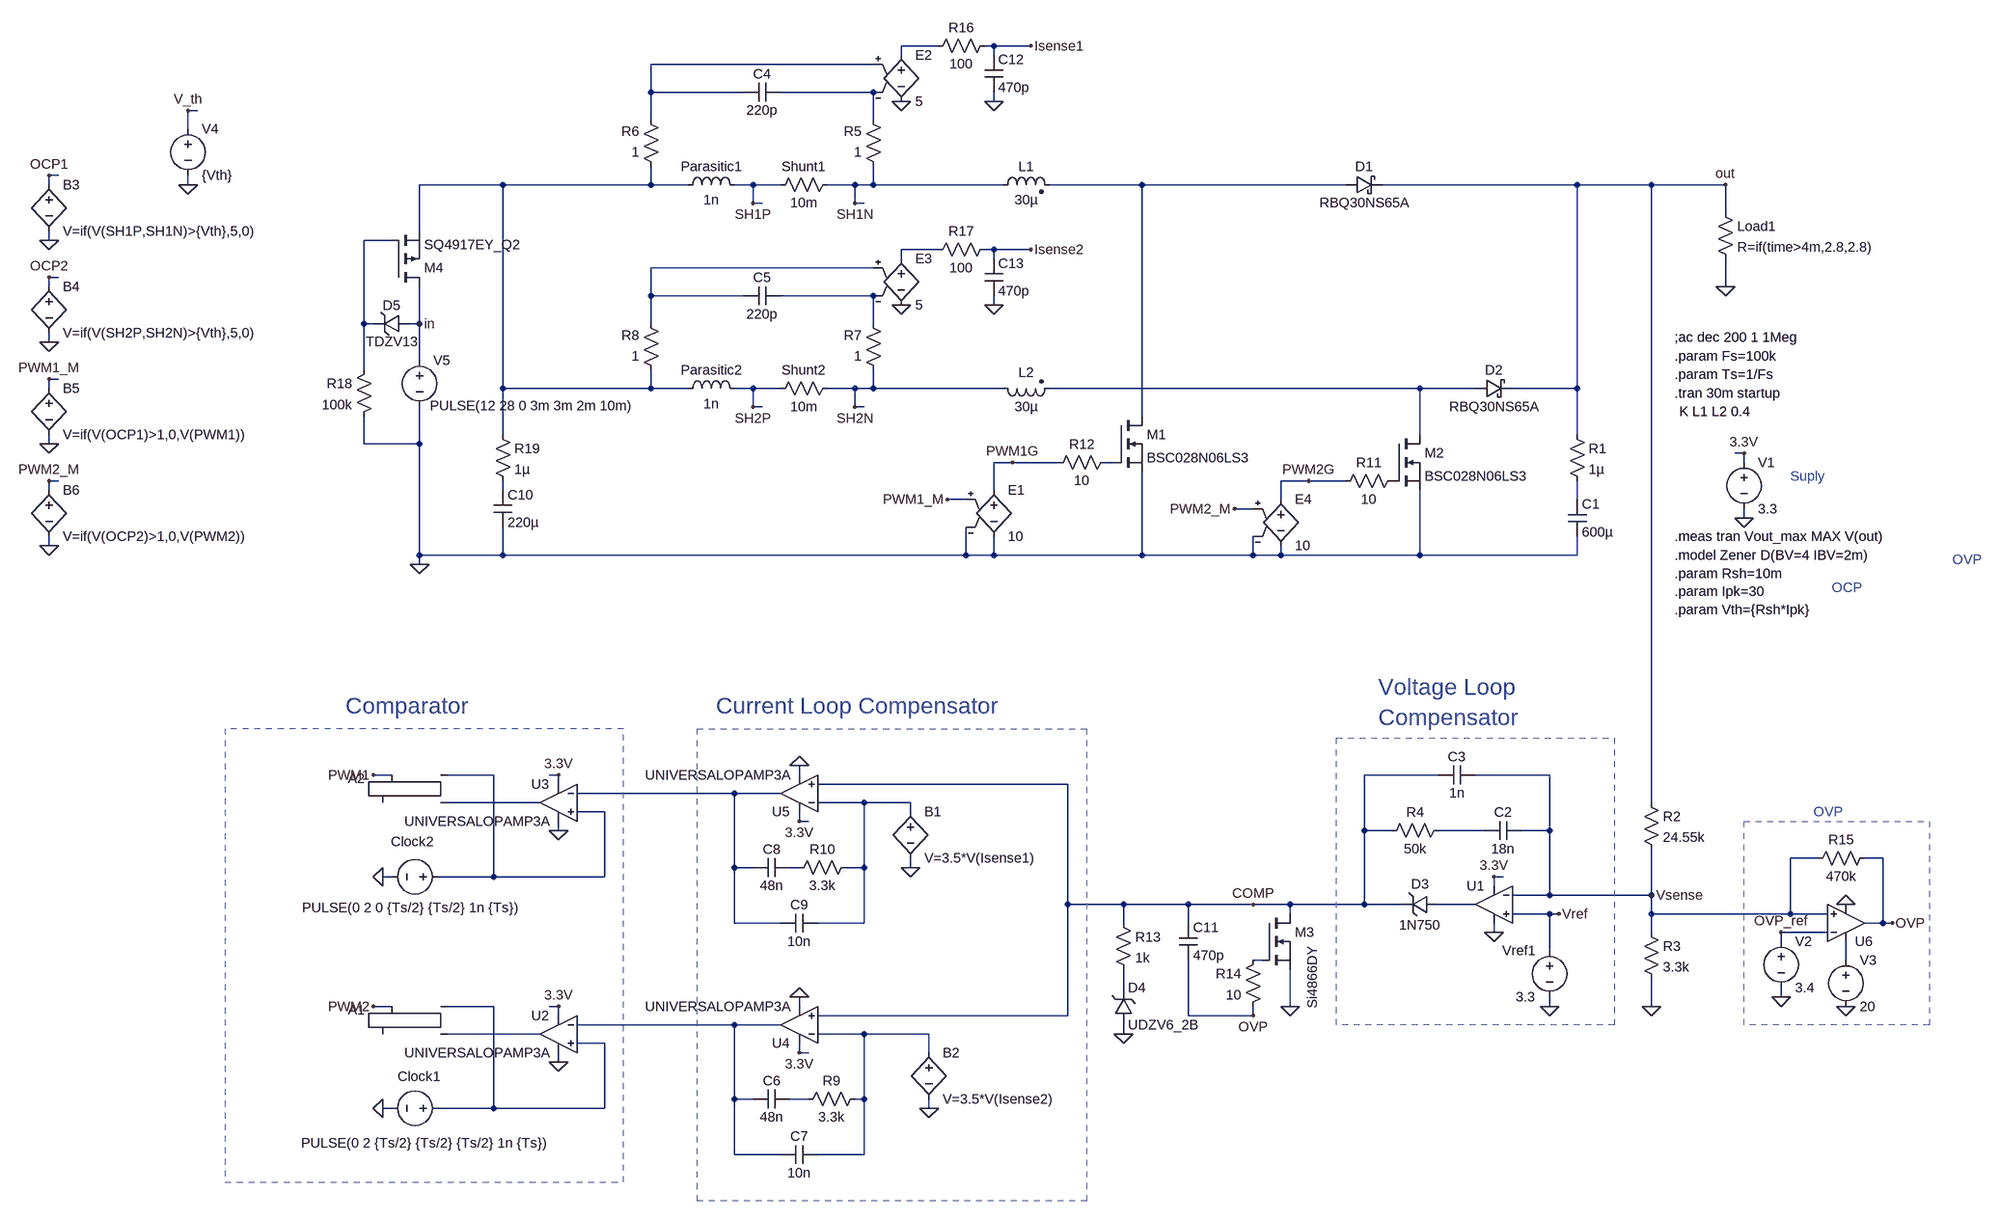
[diagram p0: schematic Analog_ACMC.asc]
Analog_ACMC.asc, the LTspice schematic file:
Version 4
SHEET 1 1736 1012
WIRE -80 -1168 -144 -1168
WIRE 16 -1168 0 -1168
WIRE 80 -1168 16 -1168
WIRE -144 -1152 -144 -1168
WIRE 16 -1152 16 -1168
WIRE -192 -1136 -576 -1136
WIRE -576 -1088 -576 -1136
WIRE -416 -1088 -576 -1088
WIRE -192 -1088 -352 -1088
WIRE 16 -1072 16 -1088
WIRE -1360 -1056 -1376 -1056
WIRE -576 -1040 -576 -1088
WIRE -192 -1040 -192 -1088
WIRE -1376 -1024 -1376 -1056
WIRE -1600 -944 -1616 -944
WIRE -1616 -928 -1616 -944
WIRE -1376 -928 -1376 -944
WIRE -832 -928 -976 -928
WIRE -576 -928 -576 -960
WIRE -576 -928 -832 -928
WIRE -512 -928 -576 -928
WIRE -400 -928 -432 -928
WIRE -352 -928 -400 -928
WIRE -224 -928 -272 -928
WIRE -192 -928 -192 -960
WIRE -192 -928 -224 -928
WIRE 32 -928 -192 -928
WIRE 272 -928 112 -928
WIRE 624 -928 272 -928
WIRE 1024 -928 688 -928
WIRE 1152 -928 1024 -928
WIRE 1280 -928 1152 -928
WIRE -400 -896 -400 -928
WIRE -384 -896 -400 -896
WIRE -224 -896 -224 -928
WIRE -208 -896 -224 -896
WIRE 1280 -880 1280 -928
WIRE -976 -848 -976 -928
WIRE -1616 -832 -1616 -848
WIRE -1024 -832 -1072 -832
WIRE -80 -816 -144 -816
WIRE 16 -816 0 -816
WIRE 80 -816 16 -816
WIRE -144 -800 -144 -816
WIRE 16 -800 16 -816
WIRE -192 -784 -576 -784
WIRE -1600 -768 -1616 -768
WIRE -1616 -752 -1616 -768
WIRE 1280 -752 1280 -800
WIRE -576 -736 -576 -784
WIRE -416 -736 -576 -736
WIRE -192 -736 -352 -736
WIRE 16 -720 16 -736
WIRE -1072 -688 -1072 -832
WIRE -1056 -688 -1072 -688
WIRE -976 -688 -976 -752
WIRE -976 -688 -992 -688
WIRE -576 -688 -576 -736
WIRE -192 -688 -192 -736
WIRE -1616 -656 -1616 -672
WIRE -976 -624 -976 -688
WIRE -1072 -608 -1072 -688
WIRE -1600 -592 -1616 -592
WIRE -1616 -576 -1616 -592
WIRE -832 -576 -832 -928
WIRE -576 -576 -576 -608
WIRE -576 -576 -832 -576
WIRE -512 -576 -576 -576
WIRE -400 -576 -432 -576
WIRE -352 -576 -400 -576
WIRE -224 -576 -272 -576
WIRE -192 -576 -192 -608
WIRE -192 -576 -224 -576
WIRE 32 -576 -192 -576
WIRE 752 -576 112 -576
WIRE 848 -576 752 -576
WIRE 1024 -576 1024 -928
WIRE 1024 -576 912 -576
WIRE -400 -544 -400 -576
WIRE -384 -544 -400 -544
WIRE -224 -544 -224 -576
WIRE -208 -544 -224 -544
WIRE 272 -528 272 -928
WIRE -832 -496 -832 -576
WIRE 752 -496 752 -576
WIRE 1024 -496 1024 -576
WIRE -1616 -480 -1616 -496
WIRE -1072 -480 -1072 -528
WIRE -976 -480 -976 -544
WIRE -976 -480 -1072 -480
WIRE 1312 -464 1296 -464
WIRE 48 -448 16 -448
WIRE 128 -448 48 -448
WIRE 224 -448 208 -448
WIRE 1312 -448 1312 -464
WIRE -1600 -416 -1616 -416
WIRE 560 -416 512 -416
WIRE 624 -416 560 -416
WIRE -1616 -400 -1616 -416
WIRE -832 -400 -832 -416
WIRE 16 -400 16 -448
WIRE -32 -384 -64 -384
WIRE 512 -384 512 -416
WIRE 1024 -384 1024 -416
WIRE 464 -368 432 -368
WIRE 1312 -352 1312 -368
WIRE -1616 -304 -1616 -320
WIRE -976 -288 -976 -480
WIRE -832 -288 -832 -336
WIRE -832 -288 -976 -288
WIRE -32 -288 -32 -336
WIRE -32 -288 -832 -288
WIRE 16 -288 16 -320
WIRE 16 -288 -32 -288
WIRE 272 -288 272 -432
WIRE 272 -288 16 -288
WIRE 464 -288 464 -320
WIRE 464 -288 272 -288
WIRE 512 -288 512 -304
WIRE 512 -288 464 -288
WIRE 752 -288 752 -400
WIRE 752 -288 512 -288
WIRE 1024 -288 1024 -320
WIRE 1024 -288 752 -288
WIRE -976 -272 -976 -288
WIRE -1024 272 -1056 272
WIRE -848 272 -928 272
WIRE -736 272 -752 272
WIRE -320 272 -320 256
WIRE 784 272 656 272
WIRE 976 272 848 272
WIRE -736 288 -736 272
WIRE 144 288 -288 288
WIRE -432 304 -704 304
WIRE -352 304 -432 304
WIRE -768 320 -928 320
WIRE -208 320 -288 320
WIRE -128 320 -208 320
WIRE 1152 320 1152 -928
WIRE -656 336 -704 336
WIRE -128 336 -128 320
WIRE -320 352 -320 336
WIRE -304 352 -320 352
WIRE -736 368 -736 352
WIRE 656 368 656 272
WIRE 704 368 656 368
WIRE 864 368 784 368
WIRE 976 368 976 272
WIRE 976 368 928 368
WIRE 1440 416 1392 416
WIRE 1552 416 1520 416
WIRE -432 432 -432 304
WIRE -400 432 -432 432
WIRE -320 432 -336 432
WIRE -208 432 -208 320
WIRE -208 432 -240 432
WIRE -128 432 -128 416
WIRE -1024 448 -1040 448
WIRE -848 448 -848 272
WIRE -848 448 -944 448
WIRE -656 448 -656 336
WIRE -656 448 -848 448
WIRE 896 448 880 448
WIRE 880 464 880 448
WIRE 976 480 976 368
WIRE 976 480 912 480
WIRE 1152 480 1152 400
WIRE 1152 480 976 480
WIRE 144 496 144 288
WIRE 240 496 144 496
WIRE 352 496 240 496
WIRE 464 496 352 496
WIRE 528 496 464 496
WIRE 656 496 656 368
WIRE 656 496 528 496
WIRE 720 496 656 496
WIRE 848 496 784 496
WIRE 528 512 528 496
WIRE 976 512 912 512
WIRE 992 512 976 512
WIRE 1152 512 1152 480
WIRE 1392 512 1392 416
WIRE 1392 512 1152 512
WIRE 1456 512 1392 512
WIRE 1488 512 1488 496
WIRE -432 528 -432 432
WIRE -352 528 -432 528
WIRE -208 528 -208 432
WIRE -208 528 -288 528
WIRE 240 528 240 496
WIRE 352 528 352 496
WIRE 1552 528 1552 416
WIRE 1552 528 1520 528
WIRE 1568 528 1552 528
WIRE 880 544 880 528
WIRE 1152 544 1152 512
WIRE 1456 544 1376 544
WIRE 1376 560 1376 544
WIRE 976 576 976 512
WIRE 480 592 464 592
WIRE 1488 592 1488 560
WIRE 240 640 240 608
WIRE 1376 656 1376 640
WIRE -1024 672 -1056 672
WIRE -848 672 -928 672
WIRE -736 672 -752 672
WIRE -320 672 -320 656
WIRE 528 672 528 608
WIRE 976 672 976 656
WIRE 1152 672 1152 624
WIRE -736 688 -736 672
WIRE 144 688 144 496
WIRE 144 688 -288 688
WIRE 352 688 352 592
WIRE 464 688 464 672
WIRE 464 688 352 688
WIRE -432 704 -704 704
WIRE -352 704 -432 704
WIRE -768 720 -928 720
WIRE -208 720 -288 720
WIRE -96 720 -208 720
WIRE 240 720 240 704
WIRE -656 736 -704 736
WIRE -320 752 -320 736
WIRE -304 752 -320 752
WIRE -96 752 -96 720
WIRE -736 768 -736 752
WIRE -432 832 -432 704
WIRE -400 832 -432 832
WIRE -304 832 -336 832
WIRE -208 832 -208 720
WIRE -208 832 -224 832
WIRE -1024 848 -1040 848
WIRE -848 848 -848 672
WIRE -848 848 -944 848
WIRE -656 848 -656 736
WIRE -656 848 -848 848
WIRE -96 848 -96 832
WIRE -432 928 -432 832
WIRE -352 928 -432 928
WIRE -208 928 -208 832
WIRE -208 928 -288 928
FLAG -976 -272 0
FLAG -976 -688 in
FLAG 1280 -928 out
FLAG 1152 672 0
FLAG 1312 -352 0
FLAG 976 672 0
FLAG 1312 -464 3.3V
FLAG 880 544 0
FLAG -144 -1072 0
FLAG -1040 848 0
FLAG 1280 -752 0
FLAG 80 -1168 Isense1
FLAG -736 768 0
FLAG -144 -720 0
FLAG 80 -816 Isense2
FLAG -736 368 0
FLAG -1040 448 0
FLAG -128 432 0
FLAG -96 848 0
FLAG -320 656 0
FLAG -320 256 0
FLAG 992 512 Vref
FLAG 1152 480 Vsense
FLAG -1056 272 PWM1
FLAG -1056 672 PWM2
FLAG -64 -384 PWM1_M
FLAG 432 -368 PWM2_M
FLAG 240 720 0
FLAG 880 448 3.3V
FLAG -320 352 3.3V
FLAG -320 752 3.3V
FLAG -736 272 3.3V
FLAG -736 672 3.3V
FLAG 1488 496 0
FLAG 1568 528 OVP
FLAG 528 672 0
FLAG 1376 656 0
FLAG 1376 544 OVP_ref
FLAG 1488 672 0
FLAG 464 688 OVP
FLAG 16 -1072 0
FLAG 16 -720 0
FLAG 48 -448 PWM1G
FLAG 560 -416 PWM2G
FLAG -400 -896 SH1P
FLAG -224 -896 SH1N
FLAG -400 -544 SH2P
FLAG -224 -544 SH2N
FLAG -1616 -832 0
FLAG -1616 -656 0
FLAG -1616 -944 OCP1
FLAG -1616 -768 OCP2
FLAG -1616 -480 0
FLAG -1616 -304 0
FLAG -1616 -592 PWM1_M
FLAG -1616 -416 PWM2_M
FLAG -1376 -928 0
FLAG -1376 -1056 V_th
FLAG 464 496 COMP
SYMBOL res 1264 -896 R0
SYMATTR InstName Load1
SYMATTR Value R=if(time>4m,2.8,2.8)
SYMBOL nmos 224 -528 R0
SYMATTR InstName M1
SYMATTR Value BSC028N06LS3
SYMBOL ind2 16 -912 R270
WINDOW 0 32 56 VTop 2
WINDOW 3 5 56 VBottom 2
SYMATTR InstName L1
SYMATTR Value 30µ
SYMATTR Type ind
SYMATTR SpiceLine Rser=1u
SYMBOL res -368 -912 R270
WINDOW 0 32 56 VTop 2
WINDOW 3 0 56 VBottom 2
SYMATTR InstName Shunt1
SYMATTR Value 10m
SYMBOL res 1008 -512 R0
SYMATTR InstName R1
SYMATTR Value 1µ
SYMBOL cap 1008 -384 R0
SYMATTR InstName C1
SYMATTR Value 600µ
SYMBOL e 16 -416 R0
SYMATTR InstName E1
SYMATTR Value 10
SYMBOL Digital\\srflop -976 624 M0
SYMATTR InstName A1
SYMBOL res 1136 304 R0
SYMATTR InstName R2
SYMATTR Value 24.55k
SYMBOL res 1136 528 R0
SYMATTR InstName R3
SYMATTR Value 3.3k
SYMBOL voltage 1312 -464 R0
WINDOW 123 0 0 Left 0
WINDOW 39 0 0 Left 0
SYMATTR InstName V1
SYMATTR Value 3.3
SYMBOL OpAmps\\UniversalOpAmp2 880 496 M0
SYMATTR InstName U1
SYMBOL res 800 352 R90
WINDOW 0 0 56 VBottom 2
WINDOW 3 32 56 VTop 2
SYMATTR InstName R4
SYMATTR Value 50k
SYMBOL cap 928 352 R90
WINDOW 0 0 32 VBottom 2
WINDOW 3 32 32 VTop 2
SYMATTR InstName C2
SYMATTR Value 18n
SYMBOL cap 784 288 R270
WINDOW 0 32 32 VTop 2
WINDOW 3 0 32 VBottom 2
SYMATTR InstName C3
SYMATTR Value 1n
SYMBOL ind -528 -912 R270
WINDOW 0 32 56 VTop 2
WINDOW 3 5 56 VBottom 2
SYMATTR InstName Parasitic1
SYMATTR Value 1n
SYMBOL res -176 -944 R180
WINDOW 0 36 76 Left 2
WINDOW 3 36 40 Left 2
SYMATTR InstName R5
SYMATTR Value 1
SYMBOL res -560 -944 R180
WINDOW 0 36 76 Left 2
WINDOW 3 36 40 Left 2
SYMATTR InstName R6
SYMATTR Value 1
SYMBOL cap -416 -1072 R270
WINDOW 0 32 32 VTop 2
WINDOW 3 0 32 VBottom 2
SYMATTR InstName C4
SYMATTR Value 220p
SYMBOL e -144 -1168 R0
SYMATTR InstName E2
SYMATTR Value 5
SYMBOL voltage -928 848 R90
WINDOW 0 -70 49 VTop 2
WINDOW 3 76 41 VBottom 2
WINDOW 123 0 0 Left 0
WINDOW 39 0 0 Left 0
SYMATTR InstName Clock1
SYMATTR Value PULSE(0 2 {Ts/2} {Ts/2} {Ts/2} 1n {Ts})
SYMBOL OpAmps\\UniversalOpAmp3a -736 720 M0
SYMATTR InstName U2
SYMBOL schottky 624 -912 R270
WINDOW 0 32 32 VTop 2
WINDOW 3 0 32 VBottom 2
SYMATTR InstName D1
SYMATTR Value RBQ30NS65A
SYMATTR Description Diode
SYMATTR Type diode
SYMBOL ind2 16 -592 M90
WINDOW 0 4 56 VBottom 2
WINDOW 3 32 56 VTop 2
SYMATTR InstName L2
SYMATTR Value 30µ
SYMATTR Type ind
SYMATTR SpiceLine Rser=1u
SYMBOL schottky 848 -560 R270
WINDOW 0 32 32 VTop 2
WINDOW 3 0 32 VBottom 2
SYMATTR InstName D2
SYMATTR Value RBQ30NS65A
SYMATTR Description Diode
SYMATTR Type diode
SYMBOL nmos 704 -496 R0
SYMATTR InstName M2
SYMATTR Value BSC028N06LS3
SYMBOL res -368 -560 R270
WINDOW 0 32 56 VTop 2
WINDOW 3 0 56 VBottom 2
SYMATTR InstName Shunt2
SYMATTR Value 10m
SYMBOL ind -528 -560 R270
WINDOW 0 32 56 VTop 2
WINDOW 3 5 56 VBottom 2
SYMATTR InstName Parasitic2
SYMATTR Value 1n
SYMBOL res -176 -592 R180
WINDOW 0 36 76 Left 2
WINDOW 3 36 40 Left 2
SYMATTR InstName R7
SYMATTR Value 1
SYMBOL res -560 -592 R180
WINDOW 0 36 76 Left 2
WINDOW 3 36 40 Left 2
SYMATTR InstName R8
SYMATTR Value 1
SYMBOL cap -416 -720 R270
WINDOW 0 32 32 VTop 2
WINDOW 3 0 32 VBottom 2
SYMATTR InstName C5
SYMATTR Value 220p
SYMBOL e -144 -816 R0
SYMATTR InstName E3
SYMATTR Value 5
SYMBOL OpAmps\\UniversalOpAmp3a -736 320 M0
SYMATTR InstName U3
SYMBOL bv -128 320 R0
SYMATTR InstName B1
SYMATTR Value V=3.5*V(Isense1)
SYMBOL Digital\\srflop -976 224 M0
SYMATTR InstName A2
SYMBOL voltage -928 448 R90
WINDOW 0 -76 61 VTop 2
WINDOW 3 69 64 VBottom 2
WINDOW 123 0 0 Left 0
WINDOW 39 0 0 Left 0
SYMATTR InstName Clock2
SYMATTR Value PULSE(0 2 0 {Ts/2} {Ts/2} 1n {Ts})
SYMBOL e 512 -400 R0
SYMATTR InstName E4
SYMATTR Value 10
SYMBOL zener 784 480 R90
WINDOW 0 -4 32 VBottom 2
WINDOW 3 36 32 VTop 2
SYMATTR InstName D3
SYMATTR Value 1N750
SYMBOL bv -96 736 R0
SYMATTR InstName B2
SYMATTR Value V=3.5*V(Isense2)
SYMBOL OpAmps\\UniversalOpAmp3a -320 704 R180
SYMATTR InstName U4
SYMBOL res -320 848 R270
WINDOW 0 32 56 VTop 2
WINDOW 3 0 56 VBottom 2
SYMATTR InstName R9
SYMATTR Value 3.3k
SYMBOL cap -400 848 R270
WINDOW 0 32 32 VTop 2
WINDOW 3 0 32 VBottom 2
SYMATTR InstName C6
SYMATTR Value 48n
SYMBOL cap -288 912 R90
WINDOW 0 0 32 VBottom 2
WINDOW 3 32 32 VTop 2
SYMATTR InstName C7
SYMATTR Value 10n
SYMBOL OpAmps\\UniversalOpAmp3a -320 304 R180
SYMATTR InstName U5
SYMBOL res -336 448 R270
WINDOW 0 32 56 VTop 2
WINDOW 3 0 56 VBottom 2
SYMATTR InstName R10
SYMATTR Value 3.3k
SYMBOL cap -400 448 R270
WINDOW 0 32 32 VTop 2
WINDOW 3 0 32 VBottom 2
SYMATTR InstName C8
SYMATTR Value 48n
SYMBOL cap -288 512 R90
WINDOW 0 0 32 VBottom 2
WINDOW 3 32 32 VTop 2
SYMATTR InstName C9
SYMATTR Value 10n
SYMBOL res 720 -432 R90
WINDOW 0 0 56 VBottom 2
WINDOW 3 32 56 VTop 2
SYMATTR InstName R11
SYMATTR Value 10
SYMBOL res 224 -464 R90
WINDOW 0 0 56 VBottom 2
WINDOW 3 32 56 VTop 2
SYMATTR InstName R12
SYMATTR Value 10
SYMBOL cap -848 -400 R0
SYMATTR InstName C10
SYMATTR Value 220µ
SYMBOL res 224 512 R0
SYMATTR InstName R13
SYMATTR Value 1k
SYMBOL voltage 976 560 M0
WINDOW 123 0 0 Left 0
WINDOW 39 0 0 Left 0
SYMATTR InstName Vref1
SYMATTR Value 3.3
SYMBOL OpAmps\\UniversalOpAmp2 1488 528 M180
SYMATTR InstName U6
SYMBOL zener 224 704 M180
WINDOW 0 24 64 Left 2
WINDOW 3 24 0 Left 2
SYMATTR InstName D4
SYMATTR Value UDZV6_2B
SYMATTR Description Diode
SYMATTR Type diode
SYMBOL nmos 480 512 R0
WINDOW 3 87 56 VRight 2
SYMATTR Value Si4866DY
SYMATTR InstName M3
SYMBOL voltage 1376 544 R0
WINDOW 123 0 0 Left 0
WINDOW 39 0 0 Left 0
SYMATTR InstName V2
SYMATTR Value 3.4
SYMBOL res 480 576 M0
SYMATTR InstName R14
SYMATTR Value 10
SYMBOL cap 336 528 R0
SYMATTR InstName C11
SYMATTR Value 470p
SYMBOL voltage 1488 576 R0
WINDOW 123 0 0 Left 0
WINDOW 39 0 0 Left 0
SYMATTR InstName V3
SYMATTR Value 20
SYMBOL res 1536 400 R90
WINDOW 0 0 56 VBottom 2
WINDOW 3 32 56 VTop 2
SYMATTR InstName R15
SYMATTR Value 470k
SYMBOL res 16 -1184 R90
WINDOW 0 0 56 VBottom 2
WINDOW 3 32 56 VTop 2
SYMATTR InstName R16
SYMATTR Value 100
SYMBOL cap 0 -1152 R0
SYMATTR InstName C12
SYMATTR Value 470p
SYMBOL cap 0 -800 R0
SYMATTR InstName C13
SYMATTR Value 470p
SYMBOL res 16 -832 R90
WINDOW 0 0 56 VBottom 2
WINDOW 3 32 56 VTop 2
SYMATTR InstName R17
SYMATTR Value 100
SYMBOL bv -1616 -944 R0
SYMATTR InstName B3
SYMATTR Value V=if(V(SH1P,SH1N)>{Vth},5,0)
SYMBOL bv -1616 -768 R0
SYMATTR InstName B4
SYMATTR Value V=if(V(SH2P,SH2N)>{Vth},5,0)
SYMBOL bv -1616 -592 R0
SYMATTR InstName B5
SYMATTR Value V=if(V(OCP1)>1,0,V(PWM1))
SYMBOL bv -1616 -416 R0
SYMATTR InstName B6
SYMATTR Value V=if(V(OCP2)>1,0,V(PWM2))
SYMBOL voltage -1376 -1040 R0
SYMATTR InstName V4
SYMATTR Value {Vth}
SYMBOL pmos -1024 -752 M180
SYMATTR InstName M4
SYMATTR Value SQ4917EY_Q2
SYMBOL res -1056 -624 M0
SYMATTR InstName R18
SYMATTR Value 100k
SYMBOL zener -992 -704 R90
WINDOW 0 0 32 VBottom 2
WINDOW 3 32 32 VTop 2
SYMATTR InstName D5
SYMATTR Value TDZV13
SYMATTR Description Diode
SYMATTR Type diode
SYMBOL res -848 -512 R0
SYMATTR InstName R19
SYMATTR Value 1µ
SYMBOL voltage -976 -640 R0
WINDOW 123 24 50 Left 2
WINDOW 39 0 0 Left 0
WINDOW 3 18 94 Left 2
SYMATTR Value PULSE(12 28 0 3m 3m 2m 10m)
SYMATTR InstName V5
TEXT 1192 -632 Left 2 !.param Fs=100k
TEXT 1192 -600 Left 2 !.param Ts=1/Fs
TEXT 1192 -568 Left 2 !.tran 30m startup
TEXT 1192 -664 Left 2 !;ac dec 200 1 1Meg
TEXT 1200 -536 Left 2 !K L1 L2 0.4
TEXT -1104 152 Left 4 ;Comparator
TEXT -464 152 Left 4 ;Current Loop Compensator
TEXT 680 120 Left 4 ;Voltage Loop\nCompensator
TEXT 1192 -288 Left 2 !.model Zener D(BV=4 IBV=2m)
TEXT 1192 -320 Left 2 !.meas tran Vout_max MAX V(out)
TEXT 1432 336 Left 2 ;OVP
TEXT 1464 -232 Left 2 ;OCP
TEXT 1672 -280 Left 2 ;OVP
TEXT 1392 -424 Left 2 ;Suply
TEXT 1192 -256 Left 2 !.param Rsh=10m\n.param Ipk=30\n.param Vth={Rsh*Ipk}
RECTANGLE Normal 176 1008 -496 192 1
RECTANGLE Normal -1312 976 -624 192 1
RECTANGLE Normal 1088 704 608 208 1
RECTANGLE Normal 1632 704 1312 352 2

The netlist it stands for:
* Analog_ACMC.asc
R§Load1 out 0 R=if(time>4m,2.8,2.8)
M1 N005 N011 0 0 BSC028N06LS3
L1 SH1N N005 30µ Rser=1u
R§Shunt1 SH1P SH1N 10m
R1 out N013 1µ
C1 N013 0 600µ
E1 PWM1G 0 PWM1_M 0 10
A1 N024 N026 0 0 0 0 PWM2 0 SRFLOP
R2 out Vsense 24.55k
R3 Vsense 0 3.3k
V1 3.3V 0 3.3
XU1 Vref Vsense 3.3V 0 N020 level2 Avol=1Meg GBW=10Meg Slew=10Meg Ilimit=25m Rail=0 Vos=0 En=0 Enk=0 In=0 Ink=0 Rin=500Meg  ; pins In+ In- V+ V- OUT
R4 N018 COMP 50k
C2 Vsense N018 18n
C3 COMP Vsense 1n
L§Parasitic1 N004 SH1P 1n
R5 SH1N N003 1
R6 N004 N002 1
C4 N002 N003 220p
E2 N001 0 N002 N003 5
V§Clock1 N024 0 PULSE(0 2 {Ts/2} {Ts/2} {Ts/2} 1n {Ts})
XU2 N024 N025 3.3V 0 N026 level3a Avol=1Meg GBW=10Meg Slew=10Meg Ilimit=25m Rail=0 Vos=0 Phimargin=45 En=0 Enk=0 In=0 Ink=0 Rin=500Meg  ; UNIVERSALOPAMP3A, pins In+ In- V+ V- OUT
D1 N005 out RBQ30NS65A
L2 SH2N N010 30µ Rser=1u
D2 N010 out RBQ30NS65A
M2 N010 P001 0 0 BSC028N06LS3
R§Shunt2 SH2P SH2N 10m
L§Parasitic2 N004 SH2P 1n
R7 SH2N N009 1
R8 N004 N008 1
C5 N008 N009 220p
E3 N007 0 N008 N009 5
XU3 N014 N015 3.3V 0 N016 level3a Avol=1Meg GBW=10Meg Slew=10Meg Ilimit=25m Rail=0 Vos=0 Phimargin=45 En=0 Enk=0 In=0 Ink=0 Rin=500Meg  ; UNIVERSALOPAMP3A, pins In+ In- V+ V- OUT
B1 N017 0 V=3.5*V(Isense1)
A2 N014 N016 0 0 0 0 PWM1 0 SRFLOP
V§Clock2 N014 0 PULSE(0 2 0 {Ts/2} {Ts/2} 1n {Ts})
E4 PWM2G 0 PWM2_M 0 10
D3 N020 COMP 1N750
B2 N027 0 V=3.5*V(Isense2)
XU4 COMP N027 3.3V 0 N025 level3a Avol=1Meg GBW=10Meg Slew=10Meg Ilimit=25m Rail=0 Vos=0 Phimargin=45 En=0 Enk=0 In=0 Ink=0 Rin=500Meg  ; UNIVERSALOPAMP3A, pins In+ In- V+ V- OUT
R9 N028 N027 3.3k
C6 N025 N028 48n
C7 N027 N025 10n
XU5 COMP N017 3.3V 0 N015 level3a Avol=1Meg GBW=10Meg Slew=10Meg Ilimit=25m Rail=0 Vos=0 Phimargin=45 En=0 Enk=0 In=0 Ink=0 Rin=500Meg  ; UNIVERSALOPAMP3A, pins In+ In- V+ V- OUT
R10 N019 N017 3.3k
C8 N015 N019 48n
C9 N017 N015 10n
R11 P001 PWM2G 10
R12 N011 PWM1G 10
C10 N012 0 220µ
R13 COMP N023 1k
Vref1 Vref 0 3.3
XU6 Vsense OVP_ref N022 0 OVP level2 Avol=1Meg GBW=10Meg Slew=10Meg Ilimit=25m Rail=0 Vos=0 En=0 Enk=0 In=0 Ink=0 Rin=500Meg  ; pins In+ In- V+ V- OUT
D4 0 N023 UDZV6_2B
M3 COMP N021 0 0 Si4866DY
V2 OVP_ref 0 3.4
R14 N021 OVP 10
C11 COMP OVP 470p
V3 N022 0 20
R15 OVP Vsense 470k
R16 Isense1 N001 100
C12 Isense1 0 470p
C13 Isense2 0 470p
R17 Isense2 N007 100
B3 OCP1 0 V=if(V(SH1P,SH1N)>{Vth},5,0)
B4 OCP2 0 V=if(V(SH2P,SH2N)>{Vth},5,0)
B5 PWM1_M 0 V=if(V(OCP1)>1,0,V(PWM1))
B6 PWM2_M 0 V=if(V(OCP2)>1,0,V(PWM2))
V4 V_th 0 {Vth}
M4 in N006 N004 N004 SQ4917EY_Q2
R18 N006 0 100k
D5 in N006 TDZV13
R19 N004 N012 1µ
V5 in 0 PULSE(12 28 0 3m 3m 2m 10m)
.model D D
.lib standard.dio
.model NMOS NMOS
.model PMOS PMOS
.lib standard.mos
.param Fs=100k
.param Ts=1/Fs
.tran 30m startup
;ac dec 200 1 1Meg
K L1 L2 0.4
* Comparator
* Current Loop Compensator
* Voltage Loop
* Compensator
.model Zener D(BV=4 IBV=2m)
.meas tran Vout_max MAX V(out)
* OVP
* OCP
* OVP
* Suply
.param Rsh=10m
.param Ipk=30
.param Vth={Rsh*Ipk}
.lib UniversalOpAmp2.lib
.backanno
.end